# EasyEDA Pro project ProPrj_Resona_2026-08-17.epro, board PCB1
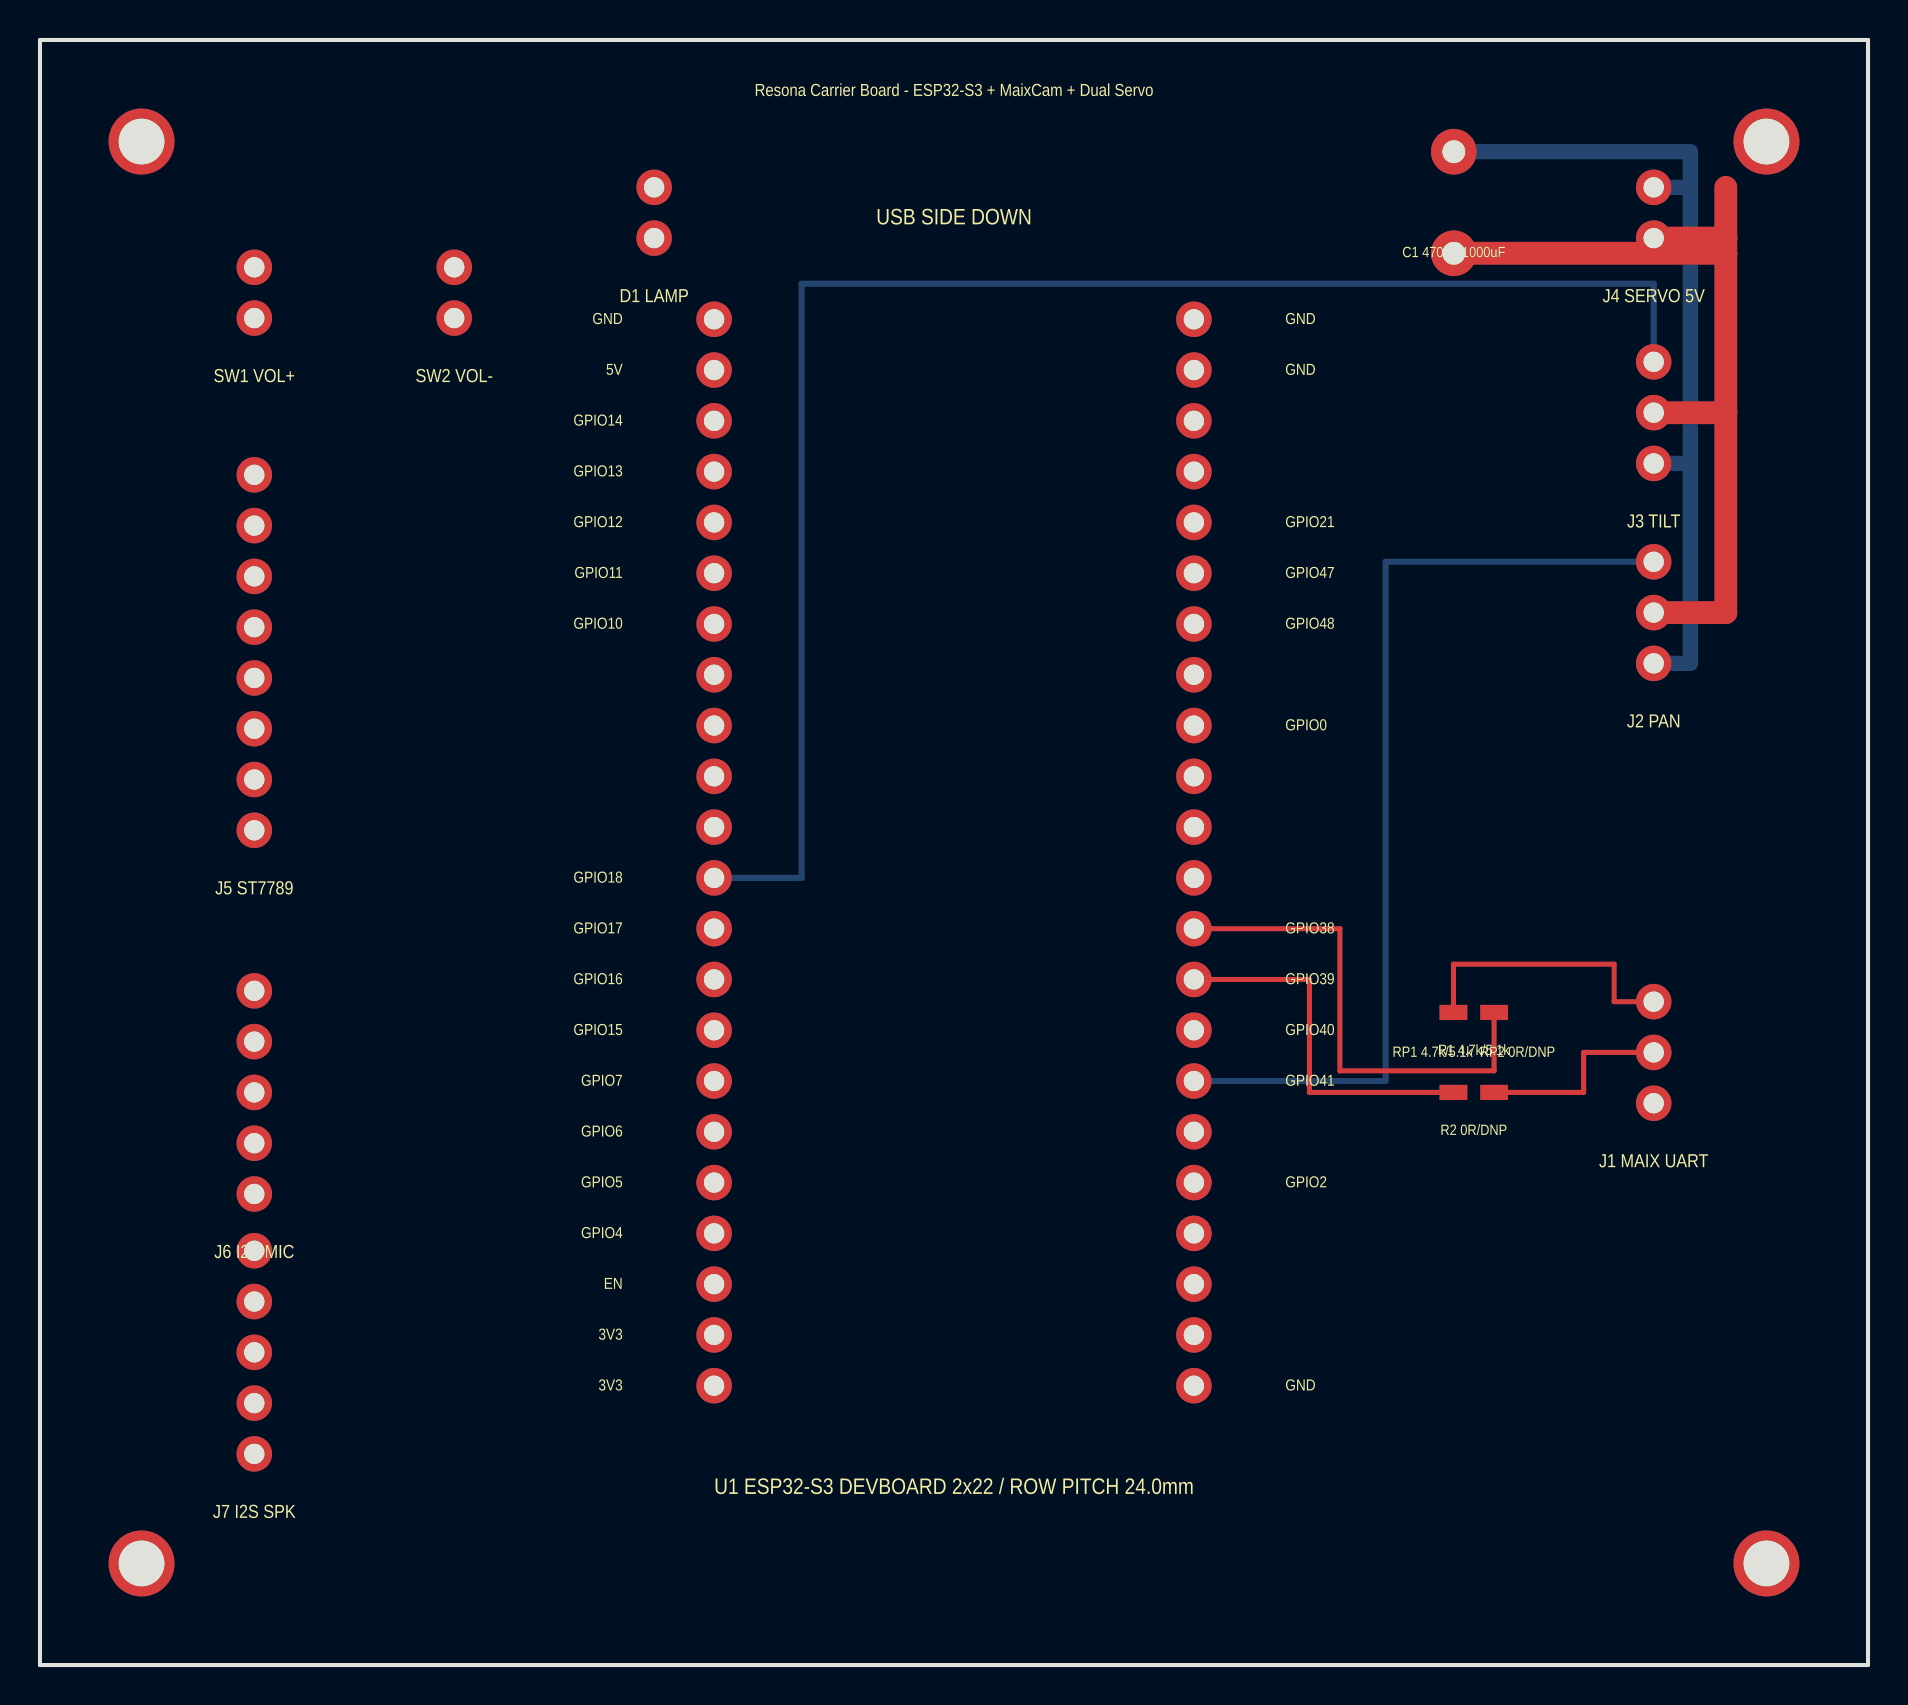
[diagram p4: board, top side]
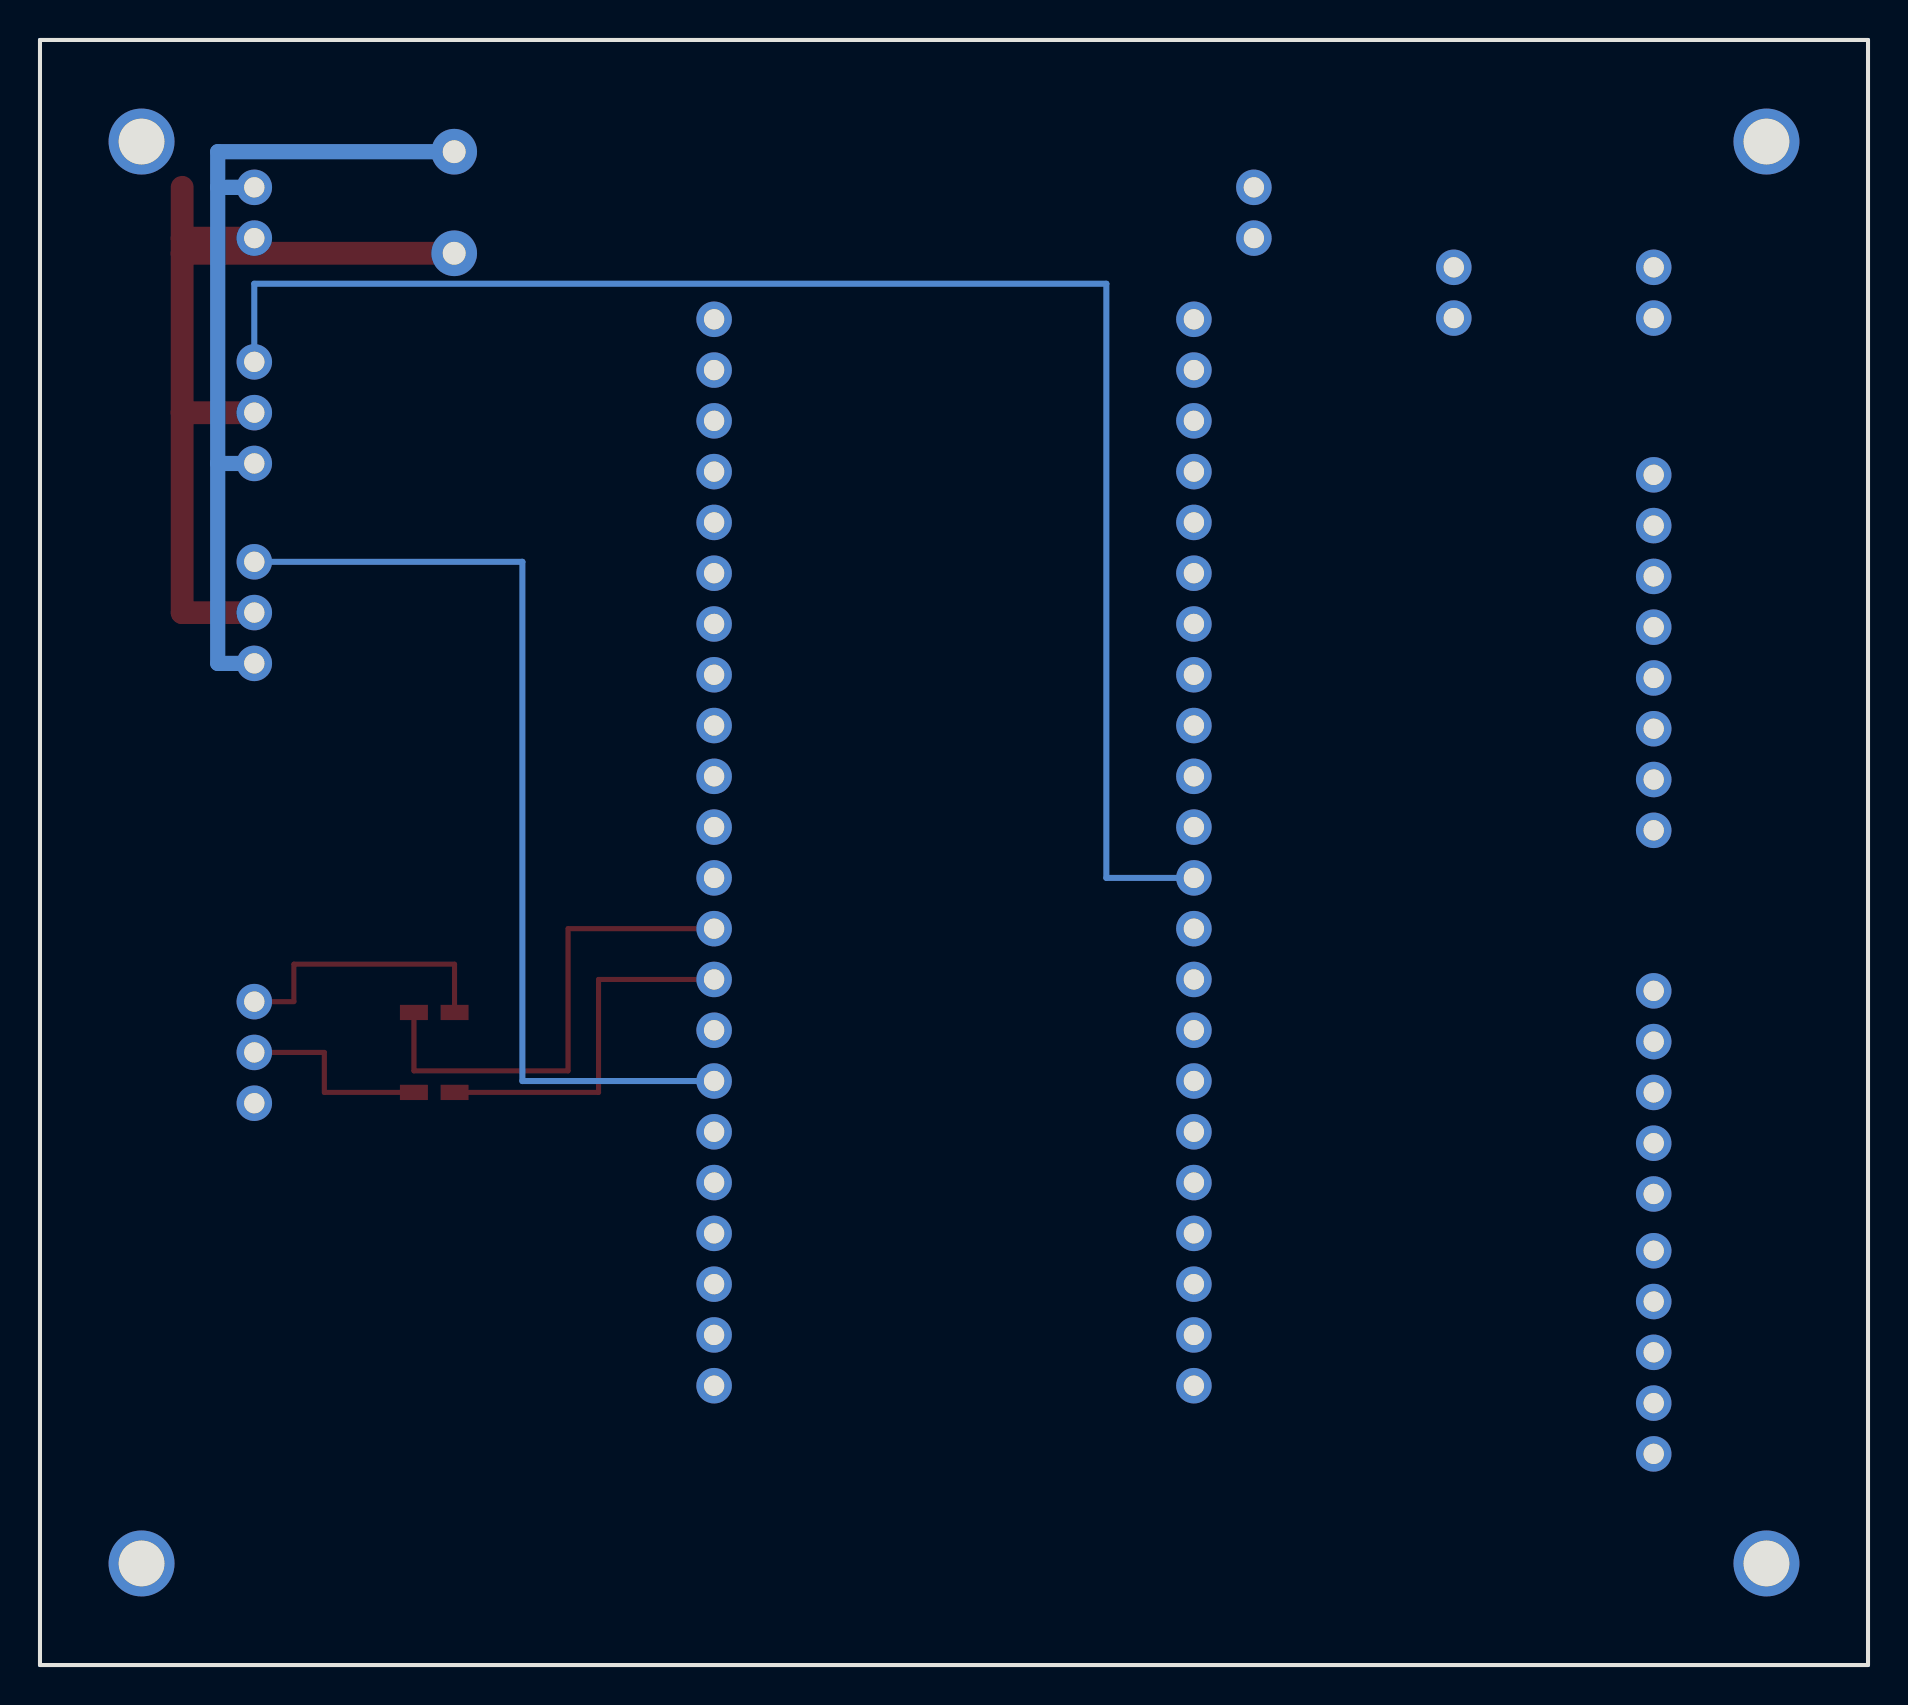
[diagram p5: board, bottom side, seen from below]

Outline 91.44 x 81.28 mm; copper layers: Top Layer, Bottom Layer. Coordinates in mm from the lower left corner of the outline.
Outline path: 0,81.28 0,0 91.44,0 91.44,81.28 0,81.28
Stack: Top Layer 0.035mm / Dielectric1 1.51mm FR4 er 4.5 / Bottom Layer 0.035mm

## Design rules (mm)
spacing copperThickness1oz (default): track to track 0.102, other pairs 0.152 to 0.3
spacing copperThickness2oz: track to track 0.203, other pairs 0.152 to 0.3
track width copperThickness1oz (default): min 0.127, default 0.254, max 2.54
track width copperThickness2oz: min 0.203, default 0.254, max 2.54
differential pair differentialPair (default): width min 0.127, default 0.254, max 2.54; gap min 0.152, default 0.152

## Placement (name value [footprint] x y rotation side)
NOREF  -  [Pad_e43]  57.72 16.51 0 top
NOREF#2  -  [Pad_e89]  80.72 65.18 0 top
NOREF#3  -  [Pad_e98]  10.72 51.91 0 top
NOREF#4  -  [Pad_e87]  80.72 60.1 0 top
NOREF#5  -  [Pad_e57]  57.72 39.37 0 top
NOREF#6  -  [Pad_e17]  33.72 34.29 0 top
NOREF#7  -  [Pad_e115]  10.72 67.37 0 top
NOREF#8  -  [Pad_e124]  70.72 70.61 0 top
NOREF#9  -  [Pad_e15]  33.72 31.75 0 top
NOREF#10  -  [Pad_e35]  33.72 62.23 0 top
NOREF#11  -  [Pad_e136]  5.08 5.08 0 top
NOREF#12  -  [Pad_e109]  10.72 10.56 0 top
NOREF#13  -  [Pad_e127]  70.7 32.64 0 top
NOREF#14  -  [Pad_e67]  57.72 57.15 0 top
NOREF#15  -  [Pad_e60]  57.72 46.99 0 top
NOREF#16  -  [Pad_e39]  33.72 67.31 0 top
NOREF#17  -  [Pad_e121]  30.72 71.37 0 top
NOREF#18  -  [Pad_e113]  10.72 20.72 0 top
NOREF#19  -  [Pad_e88]  80.72 62.64 0 top
NOREF#20  -  [Pad_e13]  33.72 29.21 0 top
NOREF#21  -  [Pad_e100]  10.72 56.99 0 top
NOREF#22  -  [Pad_e106]  10.72 31.18 0 top
NOREF#23  -  [Pad_e77]  80.72 28.1 0 top
NOREF#24  -  [Pad_e125]  70.72 75.69 0 top
NOREF#25  -  [Pad_e33]  33.72 59.69 0 top
NOREF#26  -  [Pad_e139]  5.08 76.2 0 top
NOREF#27  -  [Pad_e37]  33.72 64.77 0 top
NOREF#28  -  [Pad_e51]  57.72 31.75 0 top
NOREF#29  -  [Pad_e103]  10.72 23.56 0 top
NOREF#30  -  [Pad_e83]  80.72 50.1 0 top
NOREF#31  -  [Pad_e5]  33.72 19.05 0 top
NOREF#32  -  [Pad_e130]  72.74 28.64 0 top
NOREF#33  -  [Pad_e55]  57.72 36.83 0 top
NOREF#34  -  [Pad_e101]  10.72 59.53 0 top
NOREF#35  -  [Pad_e24]  33.72 44.45 0 top
NOREF#36  -  [Pad_e95]  10.72 44.29 0 top
NOREF#37  -  [Pad_e107]  10.72 33.72 0 top
NOREF#38  -  [Pad_e7]  33.72 21.59 0 top
NOREF#39  -  [Pad_e69]  57.72 59.69 0 top
NOREF#40  -  [Pad_e45]  57.72 21.59 0 top
NOREF#41  -  [Pad_e97]  10.72 49.37 0 top
NOREF#42  -  [Pad_e79]  80.72 33.18 0 top
NOREF#43  -  [Pad_e62]  57.72 49.53 0 top
NOREF#44  -  [Pad_e3]  33.72 16.51 0 top
NOREF#45  -  [Pad_e119]  20.72 69.91 0 top
NOREF#46  -  [Pad_e84]  80.72 52.64 0 top
NOREF#47  -  [Pad_e46]  57.72 24.13 0 top
NOREF#48  -  [Pad_e58]  57.72 41.91 0 top
NOREF#49  -  [Pad_e99]  10.72 54.45 0 top
NOREF#50  -  [Pad_e91]  80.72 71.37 0 top
NOREF#51  -  [Pad_e65]  57.72 54.61 0 top
NOREF#52  -  [Pad_e96]  10.72 46.83 0 top
NOREF#53  -  [Pad_e53]  57.72 34.29 0 top
NOREF#54  -  [Pad_e23]  33.72 41.91 0 top
NOREF#55  -  [Pad_e70]  57.72 62.23 0 top
NOREF#56  -  [Pad_e104]  10.72 26.1 0 top
NOREF#57  -  [Pad_e26]  33.72 49.53 0 top
NOREF#58  -  [Pad_e111]  10.72 15.64 0 top
NOREF#59  -  [Pad_e122]  30.72 73.91 0 top
NOREF#60  -  [Pad_e9]  33.72 24.13 0 top
NOREF#61  -  [Pad_e94]  10.72 41.75 0 top
NOREF#62  -  [Pad_e11]  33.72 26.67 0 top
NOREF#63  -  [Pad_e118]  20.72 67.37 0 top
NOREF#64  -  [Pad_e137]  86.36 5.08 0 top
NOREF#65  -  [Pad_e85]  80.72 55.18 0 top
NOREF#66  -  [Pad_e21]  33.72 39.37 0 top
NOREF#67  -  [Pad_e44]  57.72 19.05 0 top
NOREF#68  -  [Pad_e110]  10.72 13.1 0 top
NOREF#69  -  [Pad_e73]  57.72 67.31 0 top
NOREF#70  -  [Pad_e48]  57.72 26.67 0 top
NOREF#71  -  [Pad_e1]  33.72 13.97 0 top
NOREF#72  -  [Pad_e105]  10.72 28.64 0 top
NOREF#73  -  [Pad_e63]  57.72 52.07 0 top
NOREF#74  -  [Pad_e92]  80.72 73.91 0 top
NOREF#75  -  [Pad_e59]  57.72 44.45 0 top
NOREF#76  -  [Pad_e27]  33.72 52.07 0 top
NOREF#77  -  [Pad_e116]  10.72 69.91 0 top
NOREF#78  -  [Pad_e31]  33.72 57.15 0 top
NOREF#79  -  [Pad_e78]  80.72 30.64 0 top
NOREF#80  -  [Pad_e128]  72.74 32.64 0 top
NOREF#81  -  [Pad_e49]  57.72 29.21 0 top
NOREF#82  -  [Pad_e129]  70.7 28.64 0 top
NOREF#83  -  [Pad_e71]  57.72 64.77 0 top
NOREF#84  -  [Pad_e19]  33.72 36.83 0 top
NOREF#85  -  [Pad_e29]  33.72 54.61 0 top
NOREF#86  -  [Pad_e112]  10.72 18.18 0 top
NOREF#87  -  [Pad_e25]  33.72 46.99 0 top
NOREF#88  -  [Pad_e41]  57.72 13.97 0 top
NOREF#89  -  [Pad_e138]  86.36 76.2 0 top

## Footprints (pads in the part's own frame, mm; a bottom-side part is the same pattern mirrored in y, then rotated)
Pad_e1
  round 1.778 hole 1.016: L1(0,0)
Pad_e3
  round 1.778 hole 1.016: L2(0,0)
Pad_e5
  round 1.778 hole 1.016: L3(0,0)
Pad_e7
  round 1.778 hole 1.016: L4(0,0)
Pad_e9
  round 1.778 hole 1.016: L5(0,0)
Pad_e11
  round 1.778 hole 1.016: L6(0,0)
Pad_e13
  round 1.778 hole 1.016: L7(0,0)
Pad_e15
  round 1.778 hole 1.016: L8(0,0)
Pad_e17
  round 1.778 hole 1.016: L9(0,0)
Pad_e19
  round 1.778 hole 1.016: L10(0,0)
Pad_e21
  round 1.778 hole 1.016: L11(0,0)
Pad_e23
  round 1.778 hole 1.016: L12(0,0)
Pad_e24
  round 1.778 hole 1.016: L13(0,0)
Pad_e25
  round 1.778 hole 1.016: L14(0,0)
Pad_e26
  round 1.778 hole 1.016: L15(0,0)
Pad_e27
  round 1.778 hole 1.016: L16(0,0)
Pad_e29
  round 1.778 hole 1.016: L17(0,0)
Pad_e31
  round 1.778 hole 1.016: L18(0,0)
Pad_e33
  round 1.778 hole 1.016: L19(0,0)
Pad_e35
  round 1.778 hole 1.016: L20(0,0)
Pad_e37
  round 1.778 hole 1.016: L21(0,0)
Pad_e39
  round 1.778 hole 1.016: L22(0,0)
Pad_e41
  round 1.778 hole 1.016: R1(0,0)
Pad_e43
  round 1.778 hole 1.016: R2(0,0)
Pad_e44
  round 1.778 hole 1.016: R3(0,0)
Pad_e45
  round 1.778 hole 1.016: R4(0,0)
Pad_e46
  round 1.778 hole 1.016: R5(0,0)
Pad_e48
  round 1.778 hole 1.016: R6(0,0)
Pad_e49
  round 1.778 hole 1.016: R7(0,0)
Pad_e51
  round 1.778 hole 1.016: R8(0,0)
Pad_e53
  round 1.778 hole 1.016: R9(0,0)
Pad_e55
  round 1.778 hole 1.016: R10(0,0)
Pad_e57
  round 1.778 hole 1.016: R11(0,0)
Pad_e58
  round 1.778 hole 1.016: R12(0,0)
Pad_e59
  round 1.778 hole 1.016: R13(0,0)
Pad_e60
  round 1.778 hole 1.016: R14(0,0)
Pad_e62
  round 1.778 hole 1.016: R15(0,0)
Pad_e63
  round 1.778 hole 1.016: R16(0,0)
Pad_e65
  round 1.778 hole 1.016: R17(0,0)
Pad_e67
  round 1.778 hole 1.016: R18(0,0)
Pad_e69
  round 1.778 hole 1.016: R19(0,0)
Pad_e70
  round 1.778 hole 1.016: R20(0,0)
Pad_e71
  round 1.778 hole 1.016: R21(0,0)
Pad_e73
  round 1.778 hole 1.016: R22(0,0)
Pad_e77
  round 1.778 hole 1.016: J11(0,0)
Pad_e78
  round 1.778 hole 1.016: J12(0,0)
Pad_e79
  round 1.778 hole 1.016: J13(0,0)
Pad_e83
  round 1.778 hole 1.016: J21(0,0)
Pad_e84
  round 1.778 hole 1.016: J22(0,0)
Pad_e85
  round 1.778 hole 1.016: J23(0,0)
Pad_e87
  round 1.778 hole 1.016: J31(0,0)
Pad_e88
  round 1.778 hole 1.016: J32(0,0)
Pad_e89
  round 1.778 hole 1.016: J33(0,0)
Pad_e91
  round 1.778 hole 1.016: J41(0,0)
Pad_e92
  round 1.778 hole 1.016: J42(0,0)
Pad_e94
  round 1.778 hole 1.016: J51(0,0)
Pad_e95
  round 1.778 hole 1.016: J52(0,0)
Pad_e96
  round 1.778 hole 1.016: J53(0,0)
Pad_e97
  round 1.778 hole 1.016: J54(0,0)
Pad_e98
  round 1.778 hole 1.016: J55(0,0)
Pad_e99
  round 1.778 hole 1.016: J56(0,0)
Pad_e100
  round 1.778 hole 1.016: J57(0,0)
Pad_e101
  round 1.778 hole 1.016: J58(0,0)
Pad_e103
  round 1.778 hole 1.016: J61(0,0)
Pad_e104
  round 1.778 hole 1.016: J62(0,0)
Pad_e105
  round 1.778 hole 1.016: J63(0,0)
Pad_e106
  round 1.778 hole 1.016: J64(0,0)
Pad_e107
  round 1.778 hole 1.016: J65(0,0)
Pad_e109
  round 1.778 hole 1.016: J71(0,0)
Pad_e110
  round 1.778 hole 1.016: J72(0,0)
Pad_e111
  round 1.778 hole 1.016: J73(0,0)
Pad_e112
  round 1.778 hole 1.016: J74(0,0)
Pad_e113
  round 1.778 hole 1.016: J75(0,0)
Pad_e115
  round 1.778 hole 1.016: SW11(0,0)
Pad_e116
  round 1.778 hole 1.016: SW12(0,0)
Pad_e118
  round 1.778 hole 1.016: SW21(0,0)
Pad_e119
  round 1.778 hole 1.016: SW22(0,0)
Pad_e121
  round 1.778 hole 1.016: D11(0,0)
Pad_e122
  round 1.778 hole 1.016: D12(0,0)
Pad_e124
  round 2.286 hole 1.143: C11(0,0)
Pad_e125
  round 2.286 hole 1.143: C12(0,0)
Pad_e127
  rect 1.397x0.762 smd: RP1A(0,0)
Pad_e128
  rect 1.397x0.762 smd: RP1B(0,0)
Pad_e129
  rect 1.397x0.762 smd: RP2A(0,0)
Pad_e130
  rect 1.397x0.762 smd: RP2B(0,0)
Pad_e136
  round 3.302 hole 2.286: MH1(0,0)
Pad_e137
  round 3.302 hole 2.286: MH2(0,0)
Pad_e138
  round 3.302 hole 2.286: MH3(0,0)
Pad_e139
  round 3.302 hole 2.286: MH4(0,0)

## Nets
3V3: NOREF#29.J61 NOREF#44.L2 NOREF#61.J51 NOREF#71.L1
5V_SERVO: NOREF#8.C11 NOREF#19.J32 NOREF#46.J22 NOREF#50.J41
5V_USB: NOREF#12.J71 NOREF#27.L21
GND: NOREF#4.J31 NOREF#16.L22 NOREF#23.J11 NOREF#24.C12 NOREF#30.J21 NOREF#36.J52 NOREF#45.SW22 NOREF#56.J62 NOREF#59.D12 NOREF#68.J72 NOREF#69.R22 NOREF#74.J42 NOREF#77.SW12 NOREF#83.R21 NOREF#88.R1
BOOT: NOREF#15.R14
EN: NOREF#31.L3
LAMP_CTRL: NOREF#17.D11 NOREF#76.L16
LCD_BL: NOREF#34.J58 NOREF#47.R5
LCD_CLK: NOREF#41.J54 NOREF#78.L18
LCD_CS: NOREF#14.R18 NOREF#21.J57
LCD_DC: NOREF#3.J55 NOREF#25.L19
LCD_MOSI: NOREF#52.J53 NOREF#85.L17
LCD_RST: NOREF#10.L20 NOREF#49.J56
LED_BUILTIN: NOREF#73.R16
MAIX_RX_RAW: NOREF#32.RP2B NOREF#79.J12
MAIX_TX_RAW: NOREF#13.RP1A NOREF#42.J13
MIC_DIN: NOREF#37.J65 NOREF#62.L6
MIC_SCK: NOREF#22.J64 NOREF#60.L5
MIC_WS: NOREF#38.L4 NOREF#72.J63
SERVO_PAN_PWM: NOREF#65.J23 NOREF#81.R7
SERVO_TILT_PWM: NOREF#2.J33 NOREF#66.L11
SPK_BCLK: NOREF#9.L8 NOREF#86.J74
SPK_DOUT: NOREF#20.L7 NOREF#58.J73
SPK_LRCK: NOREF#6.L9 NOREF#18.J75
TOUCH_KEY: NOREF#51.R17
VISION_UART_RX: NOREF#33.R10 NOREF#80.RP1B
VISION_UART_TX: NOREF#53.R9 NOREF#82.RP2A
VOL_DOWN: NOREF#63.SW21 NOREF#84.L10
VOL_UP: NOREF#7.SW11 NOREF#28.R8

Pads without a net: NOREF R2; NOREF#5 R11; NOREF#11 MH1; NOREF#26 MH4; NOREF#35 L13; NOREF#39 R19; NOREF#40 R4; NOREF#43 R15; NOREF#48 R12; NOREF#54 L12; NOREF#55 R20; NOREF#57 L15; NOREF#64 MH2; NOREF#67 R3; NOREF#70 R6; NOREF#75 R13; NOREF#87 L14; NOREF#89 MH3

## Routing (per net, layer and track width the routed paths; a pad name or vN(x,y) marks a point on that pad's centre or on a via; arc(x,y) is an arc through that point)
5V_SERVO: length 45.7
  Top Layer w1.143: NOREF#19.J32 84.33,62.64 ; 84.33,62.64 84.33,70.61 ; 84.33,62.64 84.33,52.64 NOREF#46.J22 ; 80.72,71.37 84.33,71.37 ; 84.33,71.37 84.33,70.61 ; 84.33,71.37 84.33,73.91 ; NOREF#8.C11 84.33,70.61
GND: length 42.9
  Bottom Layer w0.762: 82.55,60.1 82.55,73.91 ; 82.55,60.1 NOREF#4.J31 ; 82.55,60.1 82.55,50.1 NOREF#30.J21 ; 82.55,73.91 82.55,75.69 NOREF#24.C12 ; 82.55,73.91 80.72,73.91
MAIX_RX_RAW: length 10
  Top Layer w0.254: NOREF#79.J12 77.22,30.64 77.22,28.64 NOREF#32.RP2B
MAIX_TX_RAW: length 14.3
  Top Layer w0.254: NOREF#42.J13 78.74,33.18 78.74,35.05 70.7,35.05 NOREF#13.RP1A
SERVO_PAN_PWM: length 49
  Bottom Layer w0.305: NOREF#81.R7 67.31,29.21 67.31,55.18 NOREF#65.J23
SERVO_TILT_PWM: length 80.6
  Bottom Layer w0.305: NOREF#66.L11 38.1,39.37 38.1,69.09 80.72,69.09 NOREF#2.J33
VISION_UART_RX: length 25
  Top Layer w0.254: NOREF#33.R10 65.02,36.83 65.02,29.72 72.74,29.72 NOREF#80.RP1B
VISION_UART_TX: length 18.6
  Top Layer w0.254: NOREF#82.RP2A 63.5,28.64 63.5,34.29 NOREF#53.R9

## Text on the board
Top Silkscreen Layer: RP1 4.7k/5.1k  RP2 0R/DNP | C1 470uF/1000uF | R1 4.7k/5.1k | R2 0R/DNP | GND | GPIO21 | GPIO47 | GPIO48 | GPIO0 | GPIO38 | GPIO39 | GPIO40 | GPIO41 | GPIO2 | 5V | GPIO14 | GPIO13 | GPIO12 | GPIO11 | GPIO10 | GPIO18 | GPIO17 | GPIO16 | GPIO15 | GPIO7 | GPIO6 | GPIO5 | GPIO4 | EN | 3V3 | Resona Carrier Board - ESP32-S3 + MaixCam + Dual Servo | SW1 VOL+ | J5 ST7789 | J6 I2S MIC | J7 I2S SPK | SW2 VOL- | D1 LAMP | J4 SERVO 5V | J3 TILT | J2 PAN | J1 MAIX UART | USB SIDE DOWN | U1 ESP32-S3 DEVBOARD 2x22 / ROW PITCH 24.0mm
